# Altium schematic sheet Flash_Sheet.SchDoc
size A4; DocumentNumber: 26; SheetNumber: 26; SheetTotal: 27
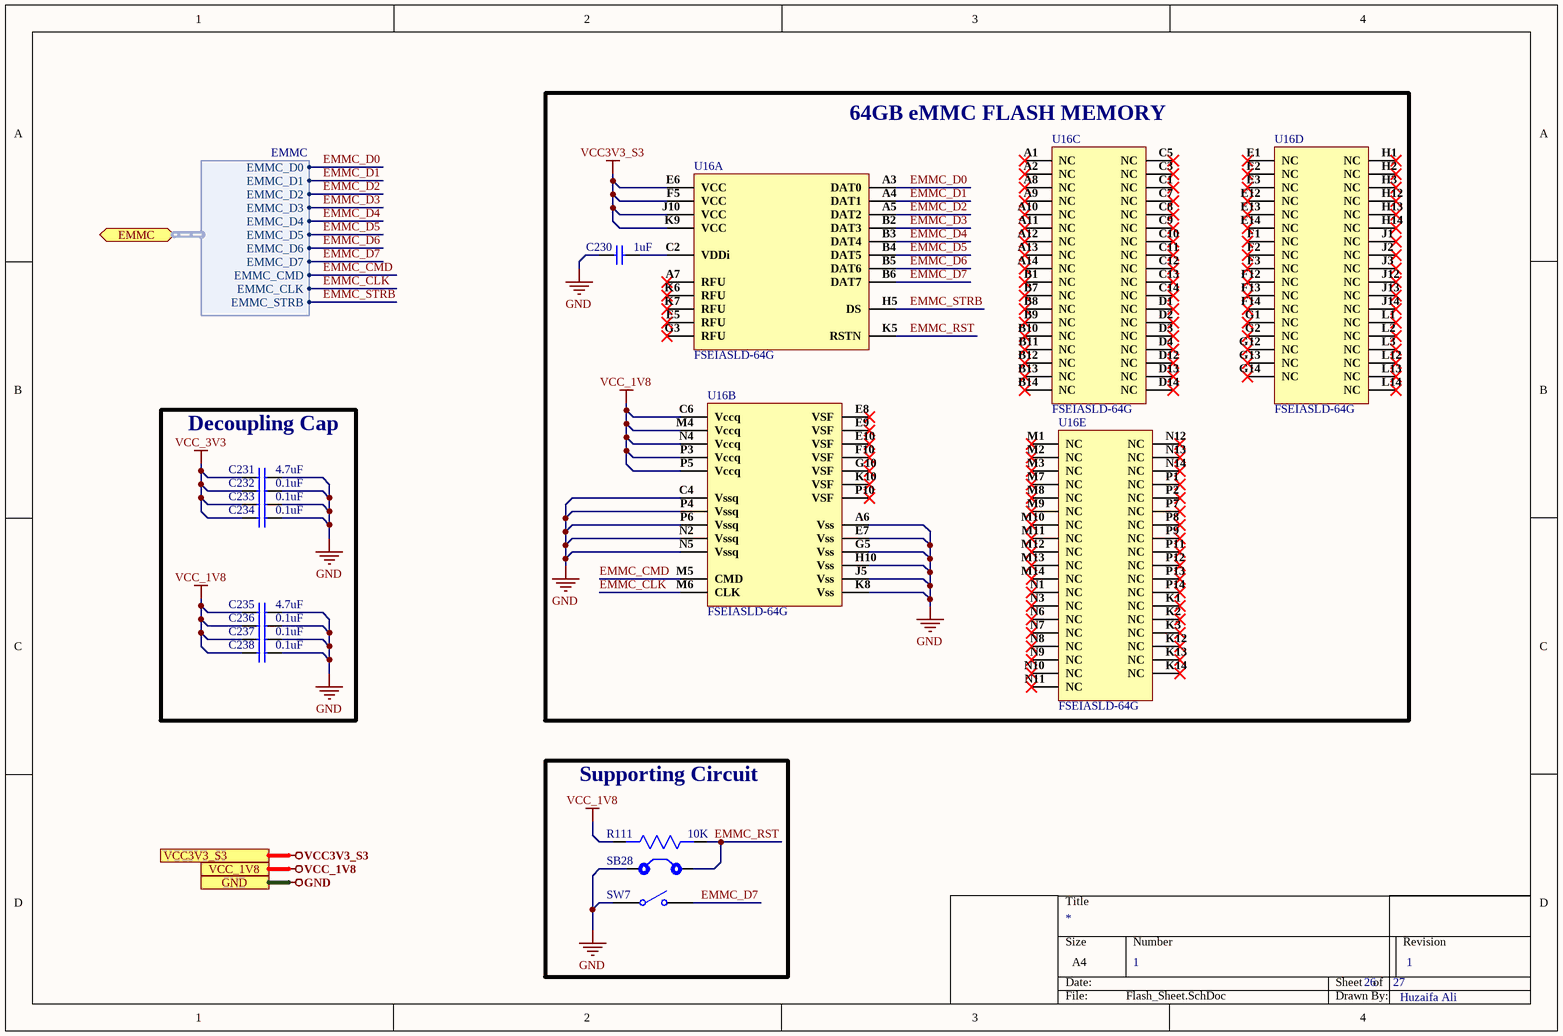
[diagram p0: Flash_Sheet.SchDoc]

## Parts
C230  1uF  [Cap0402]
C231  4.7uF  [Cap 0402]
C232  0.1uF  [Cap 0402]
C233  0.1uF  [Cap 0402]
C234  0.1uF  [Cap 0402]
C235  4.7uF  [Cap 0402]
C236  0.1uF  [Cap 0402]
C237  0.1uF  [Cap 0402]
C238  0.1uF  [Cap 0402]
R111  10K  [Res0603]
SB28  Solder Bridge  [Solder Bridge]  (value not drawn)
SW7  TS-1185EC-C-D-B  [TS-1185EC-C-D-B]  (value not drawn)
U16  FSEIASLD-64G  [BGA-153]  (parts A,B,C,D,E of 5)

## Blocks framed on the sheet
64GB eMMC FLASH MEMORY: C230 U16
Decoupling Cap: C231-C238
Supporting Circuit: R111 SB28 SW7

## Ports
EMMC (bidir, harness EMMC), GND, VCC3V3_S3, VCC_1V8

## Harnesses
EMMC: EMMC_D0, EMMC_D1, EMMC_D2, EMMC_D3, EMMC_D4, EMMC_D5, EMMC_D6, EMMC_D7, EMMC_CMD, EMMC_CLK, EMMC_STRB

## Nets
GND: C230.1 C231.2 C232.2 C233.2 C234.2 C235.2 C236.2 C237.2 C238.2 SB28.1 SW7.1 U16.A6(Vss) U16.C4(Vssq) U16.E7(Vss) U16.G5(Vss) U16.H10(Vss) U16.J5(Vss) U16.K8(Vss) U16.N2(Vssq) U16.N5(Vssq) U16.P4(Vssq) U16.P6(Vssq) ; port GND
VCC3V3_S3: U16.E6(VCC) U16.F5(VCC) U16.J10(VCC) U16.K9(VCC) ; port VCC3V3_S3
VCC_1V8: C235.1 C236.1 C237.1 C238.1 R111.2 U16.C6(Vccq) U16.M4(Vccq) U16.N4(Vccq) U16.P3(Vccq) U16.P5(Vccq) ; port VCC_1V8
VCC_3V3: C231.1 C232.1 C233.1 C234.1
EMMC_CLK: U16.M6(CLK) ; port EMMC.EMMC_CLK
EMMC_CMD: U16.M5(CMD) ; port EMMC.EMMC_CMD
EMMC_D0: U16.A3(DAT0) ; port EMMC.EMMC_D0
EMMC_D1: U16.A4(DAT1) ; port EMMC.EMMC_D1
EMMC_D2: U16.A5(DAT2) ; port EMMC.EMMC_D2
EMMC_D3: U16.B2(DAT3) ; port EMMC.EMMC_D3
EMMC_D4: U16.B3(DAT4) ; port EMMC.EMMC_D4
EMMC_D5: U16.B4(DAT5) ; port EMMC.EMMC_D5
EMMC_D6: U16.B5(DAT6) ; port EMMC.EMMC_D6
EMMC_D7: SW7.2 U16.B6(DAT7) ; port EMMC.EMMC_D7
EMMC_RST: R111.1 SB28.2 U16.K5(RSTN)
EMMC_STRB: U16.H5(DS) ; port EMMC.EMMC_STRB
NetC230_2: C230.2 U16.C2(VDDi)

Not connected (* = marked no-connect by the designer): U16 A1(NC)* A2(NC)* A7(RFU)* A8(NC)* A9(NC)* A10(NC)* A11(NC)* A12(NC)* A13(NC)* A14(NC)* B1(NC)* B7(NC)* B8(NC)* B9(NC)* B10(NC)* B11(NC)* B12(NC)* B13(NC)* B14(NC)* C1(NC)* C3(NC)* C5(NC)* C7(NC)* C8(NC)* C9(NC)* C10(NC)* C11(NC)* C12(NC)* C13(NC)* C14(NC)* D1(NC)* D2(NC)* D3(NC)* D4(NC)* D12(NC)* D13(NC)* D14(NC)* E1(NC)* E2(NC)* E3(NC)* E5(RFU)* E8(VSF)* E9(VSF)* E10(VSF)* E12(NC)* E13(NC)* E14(NC)* F1(NC)* F2(NC)* F3(NC)* F10(VSF)* F12(NC)* F13(NC)* F14(NC)* G1(NC)* G2(NC)* G3(RFU)* G10(VSF)* G12(NC)* G13(NC)* G14(NC)* H1(NC)* H2(NC)* H3(NC)* H12(NC)* H13(NC)* H14(NC)* J1(NC)* J2(NC)* J3(NC)* J12(NC)* J13(NC)* J14(NC)* K1(NC)* K2(NC)* K3(NC)* K6(RFU)* K7(RFU)* K10(VSF)* K12(NC)* K13(NC)* K14(NC)* L1(NC)* L2(NC)* L3(NC)* L12(NC)* L13(NC)* L14(NC)* M1(NC)* M2(NC)* M3(NC)* M7(NC)* M8(NC)* M9(NC)* M10(NC)* M11(NC)* M12(NC)* M13(NC)* M14(NC)* N1(NC)* N3(NC)* N6(NC)* N7(NC)* N8(NC)* N9(NC)* N10(NC)* N11(NC)* N12(NC)* N13(NC)* N14(NC)* P1(NC)* P2(NC)* P7(NC)* P8(NC)* P9(NC)* P10(VSF)* P11(NC)* P12(NC)* P13(NC)* P14(NC)*

## Notes on the sheet
- 1
- Huzaifa Ali

## Library data of the parts
C230 = GRM155R61E105KA12D: CAP CER 1UF 25V X5R 0402; Manufacturer: Murata; Material: Ceramic; Tolerance: 10%; Supplier 1: Digi-Key; Manufacturer Part Number: GRM155R61E105KA12D; Stock 1: 1194305; Pricing 1: 1=0.11, 10=0.077, 100=0.0363, 500=0.02546, 1000=0.02108, 2500=0.01962, 5000=0.01795 (USD); Mount: Surface Mount; Case/Package: 0402; Weight: 0.000212oz; Case Code (Metric): 1005; Case Code (Imperial): 0402; Min Operating Temperature: -55°C; Max Operating Temperature: 85°C; Capacitance: 1uF; Voltage Rating: 25V; Packaging: Tape and Reel; Dielectric: X5R; Voltage: 25V; Termination: SMD/SMT; Voltage Rating (DC): 25V; Package Quantity: 10000; Length: 1mm; Height: 0.5mm; Width: 0.5mm; Thickness: 0.022inch; Depth: 0.5mm; REACH SVHC: No SVHC; Lead Free: Lead Free; ComponentLink1URL: http://www.farnell.com/datasheets/2048341.pdf?src-supplier=Element14; ComponentLink1Description: http://www.farnell.com/datasheets/2048341.pdf?src-supplier=Element14; Supplier Part Number 1: 490-10017-1-ND
C231 C235 = EDK105BBJ475MVLF: 16V 4.7uF ±20% 0402 Multilayer Ceramic Capacitors MLCC; Manufacturer: Taiyo Yuden; Manufacturer Part Number: EDK105BBJ475MVLF; Footprint: 0402; Value: 4.7uF
C232-C234 C236-C238 = GRM155R71H104ME14D: CAP CER 0.1UF 50V X7R 0402; Manufacturer: Murata; Tolerance: 20%; Capacitance: 100nF; Supplier 1: Digi-Key; Manufacturer Part Number: GRM155R71H104ME14D; Stock 1: 439844; Pricing 1: 1=0.1, 10=0.038, 100=0.0168, 500=0.01198, 1000=0.00941, 2500=0.00855, 5000=0.00787 (USD); Mount: Surface Mount; Case/Package: 0402; Min Operating Temperature: -55°C; Max Operating Temperature: 125°C; Packaging: Cut Tape; Voltage Rating: 50V; Length: 0.039inch; Width: 0.02inch; Thickness: 0.022inch; ComponentLink1URL: http://search.murata.co.jp/Ceramy/image/img/A01X/G101/ENG/GRM155R71H104ME14-01.pdf?src-supplier=Digi-Key; ComponentLink1Description: http://search.murata.co.jp/Ceramy/image/img/A01X/G101/ENG/GRM155R71H104ME14-01.pdf?src-supplier=Digi-Key; ComponentLink2URL: http://psearch.en.murata.com/capacitor/product/GRM155R71H104ME14%23.pdf?src-supplier=Avnet; ComponentLink2Description: http://psearch.en.murata.com/capacitor/product/GRM155R71H104ME14%23.pdf?src-supplier=Avnet; ComponentLink3URL: http://components.arrow.com/part/dataview/0323_07177683?src-supplier=Arrow+Europe; ComponentLink3Description: http://components.arrow.com/part/dataview/0323_07177683?src-supplier=Arrow+Europe; ComponentLink4URL: http://www.mouser.com/ds/2/281/c02e-2905.pdf?src-supplier=Mouser; ComponentLink4Description: http://www.mouser.com/ds/2/281/c02e-2905.pdf?src-supplier=Mouser; Supplier Part Number 1: 490-10701-1-ND
R111 = AC0603JR-0710KL: RES SMD 10K OHM 5% 1/10W 0603; Manufacturer: Yageo; Voltage Rating: 50V; Resistance: 10kR; Power Rating: 100mW; Temperature Coefficient: 100ppm/°C; Supplier 1: Future Electronics; Manufacturer Part Number: AC0603JR-0710KL; RoHS: Yes; Category: Chip SMD Resistors; Stock 1: 1533000; Pricing 1: 5000=0.00540 (USD); Case/Package: 0603; Case Code (Imperial): 0603; Case Code (Metric): 1608; Size Code: 0603; Min Operating Temperature: -55°C; Max Operating Temperature: 155°C; Packaging: Tape and Reel; Tolerance: 5%; Package Quantity: 1; Resistor Type: Thick Film; Termination: SMD/SMT; Number of Terminations: 2; Max Power Dissipation: 100mW; Features: Moisture Resistant,Automotive AEC-Q200,Anti-Sulfur; Series: AC; Construction: Rectangular; Length: 0.063inch; Width: 0.031inch; Height: 0.022inch; Depth: 0.8mm; Military Standard: Not; Lead Free: Lead Free; RoHS Compliant: Yes; ComponentLink1URL: https://datasheet.ciiva.com/5562/pyu-ac-51-rohs-l-2-5562553.pdf?src-supplier=Mouser; ComponentLink1Description: https://datasheet.ciiva.com/5562/pyu-ac-51-rohs-l-2-5562553.pdf?src-supplier=Mouser; Supplier Part Number 1: 1029044
SB28 = Solder Bridge: Solder Bridge ON
SW7 = TS-1185EC-C-D-B: 3mm 2mm Round Button 50mA Top3.65mm SPST 12V SMD Tactile Switches; Manufacturer: XKB; Manufacturer Part Number: TS-1185EC-C-D-B; Footprint: Custom; ComponentLink1Description: LCSC; ComponentLink1URL: https://lcsc.com/product-detail/Tactile-Switches_XKB-Connectivity-TS-1185EC-C-D-B_C318893.html
U16 = FSEIASLD-64G: BGA-153 eMMC ROHS; Manufacturer: FORESEE; Manufacturer Part Number: FSEIASLD-64G; ComponentLink1Description: LCSC; ComponentLink1URL: https://lcsc.com/product-detail/eMMC_FORESEE-FSEIASLD-64G_C719922.html